# Altium schematic sheet Sheet2.SchDoc
size A; SheetNumber: 2; SheetTotal: 2
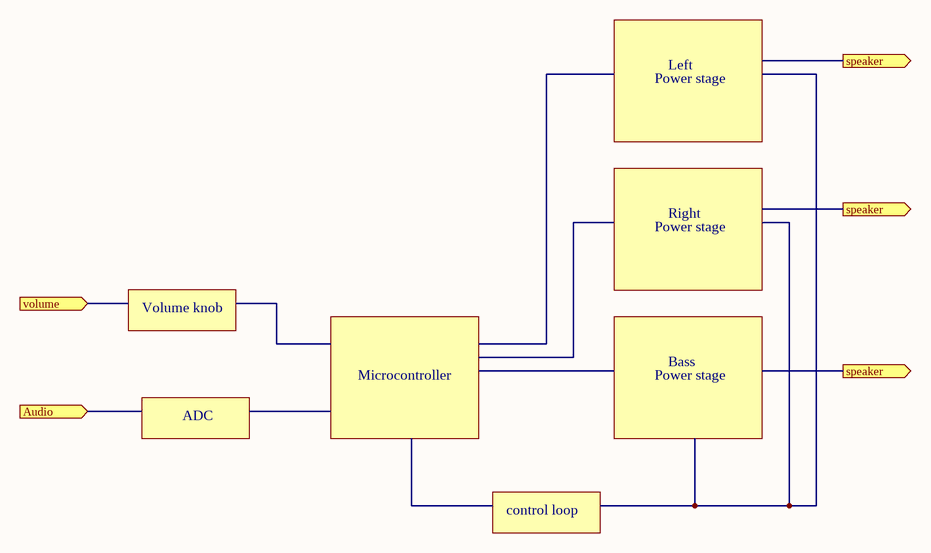
[diagram p0: Sheet2.SchDoc]

## Ports
Audio (in), speaker (out), volume (in)

## Notes on the sheet
- Left
- Power stage
- Right
- Volume knob
- Microcontroller
- Bass
- ADC
- control loop